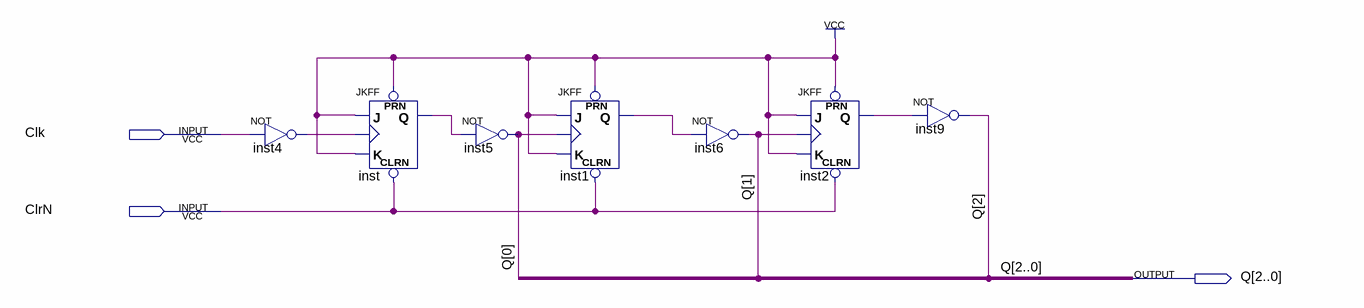
[diagram p0: schematic sheet]
// Quartus schematic Rippledown.bdf as structural Verilog: 7 symbols, 3 pins
module Rippledown (
  input  Clk,
  input  ClrN,
  output [2:0] Q
);

  wire inst1_q, inst2_q, inst4_out, inst_q;

  not inst4 (inst4_out, Clk);
  JKFF inst (.PRN(1'b1), .CLRN(ClrN), .K(1'b1), .J(1'b1), .CLK(inst4_out), .Q(inst_q));
  not inst5 (Q[0], inst_q);
  JKFF inst1 (.PRN(1'b1), .CLRN(ClrN), .K(1'b1), .J(1'b1), .CLK(Q[0]), .Q(inst1_q));
  not inst6 (Q[1], inst1_q);
  JKFF inst2 (.PRN(1'b1), .CLRN(ClrN), .K(1'b1), .J(1'b1), .CLK(Q[1]), .Q(inst2_q));
  not inst9 (Q[2], inst2_q);
endmodule
